# Altium schematic sheet MCU_ESP.SchDoc
size A; DocumentNumber: 5; SheetNumber: 5; SheetTotal: 14
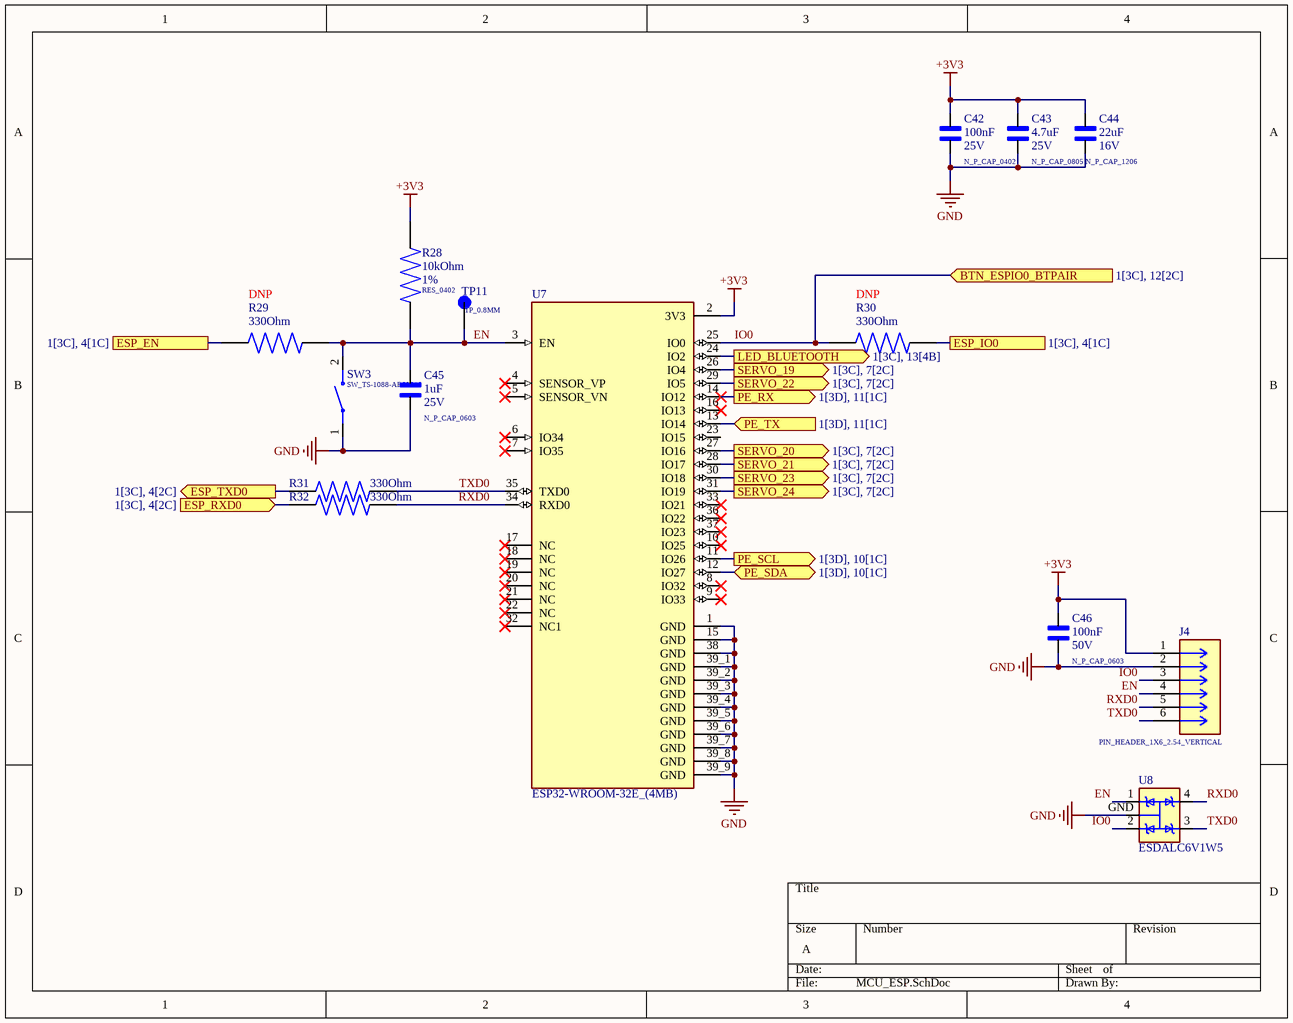
[diagram p0: MCU_ESP.SchDoc]

## Parts
C42  N_P_CAP_0402  value 100nF  Rated Voltage: 25V  [N_P_CAP_0402]
C43  N_P_CAP_0805  value 4.7uF  Rated Voltage: 25V  [N_P_CAP_0805]
C44  N_P_CAP_1206  value 22uF  Rated Voltage: 16V  [N_P_CAP_1206]
C45  N_P_CAP_0603  value 1uF  Rated Voltage: 25V  [N_P_CAP_0603]
C46  N_P_CAP_0603  value 100nF  Rated Voltage: 50V  [N_P_CAP_0603]
J4  PIN_HEADER_1X6_2.54_VERTICAL  [PIN_HEADER_1X6_2.54_VERTICAL]
R28  RES_0402  value 10kOhm  Tolerance: 1%  [RES_0402]
R29  value 330Ohm  [RES_0402]  (hidden comment: RES_0402)
R30  value 330Ohm  [RES_0402]  (hidden comment: RES_0402)
R31  value 330Ohm  [RES_0402]  (hidden comment: RES_0402)
R32  value 330Ohm  [RES_0402]  (hidden comment: RES_0402)
SW3  SW_TS-1088-AR02016  [SW_TS-1088-AR02016]
TP11  TP_0.8MM  [TP_0.8MM]
U7  ESP32-WROOM-32E_(4MB)  [XCVR_ESP32-WROOM-32E_(4MB)]
U8  ESDALC6V1W5  [SOT323-5L]

## Ports
BTN_ESPIO0_BTPAIR (in, see 1[3C], 12[2C]), ESP_EN (see 1[3C], 4[1C]), ESP_IO0 (see 1[3C], 4[1C]), ESP_RXD0 (in, see 1[3C], 4[2C]), ESP_TXD0 (out, see 1[3C], 4[2C]), LED_BLUETOOTH (out, see 1[3C], 13[4B]), PE_RX (out, see 1[3D], 11[1C]), PE_SCL (out, see 1[3D], 10[1C]), PE_SDA (bidir, see 1[3D], 10[1C]), PE_TX (in, see 1[3D], 11[1C]), SERVO_19 (out, see 1[3C], 7[2C]), SERVO_20 (out, see 1[3C], 7[2C]), SERVO_21 (out, see 1[3C], 7[2C]), SERVO_22 (out, see 1[3C], 7[2C]), SERVO_23 (out, see 1[3C], 7[2C]), SERVO_24 (out, see 1[3C], 7[2C])

## Nets
+3V3: C42.2 C43.2 C44.2 C46.2 J4.1 R28.1 U7.2(3V3)
GND: C42.1 C43.1 C44.1 C45.1 C46.1 J4.2 SW3.1 U7.1(GND) U7.15(GND) U7.38(GND) U7.39_1(GND) U7.39_2(GND) U7.39_3(GND) U7.39_4(GND) U7.39_5(GND) U7.39_6(GND) U7.39_7(GND) U7.39_8(GND) U7.39_9(GND) U8.GND
EN: C45.2 J4.4 R28.2 R29.1 SW3.2 TP11.TP U7.3(EN) U8.1(I/01)
ESP_EN: R29.2 ; port ESP_EN
ESP_IO0: R30.1 ; port ESP_IO0
ESP_RXD0: R32.2 ; port ESP_RXD0
ESP_TXD0: R31.2 ; port ESP_TXD0
IO0: J4.3 R30.2 U7.25(IO0) U8.2(I/02) ; port BTN_ESPIO0_BTPAIR
LED_BLUETOOTH: U7.24(IO2) ; port LED_BLUETOOTH
PE_RX: U7.14(IO12) ; port PE_RX
PE_SCL: U7.11(IO26) ; port PE_SCL
PE_SDA: U7.12(IO27) ; port PE_SDA
PE_TX: U7.13(IO14) ; port PE_TX
RXD0: J4.5 R32.1 U7.34(RXD0) U8.4(I/04)
SERVO_19: U7.26(IO4) ; port SERVO_19
SERVO_20: U7.27(IO16) ; port SERVO_20
SERVO_21: U7.28(IO17) ; port SERVO_21
SERVO_22: U7.29(IO5) ; port SERVO_22
SERVO_23: U7.30(IO18) ; port SERVO_23
SERVO_24: U7.31(IO19) ; port SERVO_24
TXD0: J4.6 R31.1 U7.35(TXD0) U8.3(I/03)

Not connected (* = marked no-connect by the designer): U7 4(SENSOR_VP)* 5(SENSOR_VN)* 6(IO34)* 7(IO35)* 8(IO32)* 9(IO33)* 10(IO25)* 16(IO13)* 17(NC)* 18(NC)* 19(NC)* 20(NC)* 21(NC)* 22(NC)* 23(IO15) 32(NC1)* 33(IO21)* 36(IO22)* 37(IO23)*

## Notes on the sheet
- (near R29) DNP
- (near R30) DNP

## Library data of the parts
C42 = N_P_CAP: GENERIC NON-POLARIZED CAP; Temperature Coefficient: X7R; LCSC Part Number: C105883; Tolerance: *; MF: *; ESR: *; MPN: *
C43 C45 C46 = N_P_CAP: GENERIC NON-POLARIZED CAP; Tolerance: *; MF: *; ESR: *; MPN: *; Temperature Coefficient: *
  C43: LCSC Part Number: C354262
  C45: LCSC Part Number: C106858
  C46: LCSC Part Number: C106221
C44 = N_P_CAP: GENERIC NON-POLARIZED CAP; MPN: CL31A226KOHNNNE; Tolerance: 10%; LCSC Part Number: C90146; MF: *; ESR: *; Temperature Coefficient: *
J4 = PIN_HEADER_6P: GENERIC PIN HEADER 6P; MF: *; MPN: *; LCSC Part Number: *
R28 = RES: GENERIC RES; Power Rating: *; MPN: *; Rated Voltage: *; Temperature Coefficient: *; LCSC Part Number: C60490
R29-R32 = RES: GENERIC RES; MPN: RC0402FR-07330RL; Tolerance: 1%; Power Rating: *; Rated Voltage: *; Temperature Coefficient: *; LCSC Part Number: C105875
SW3 = TACTILE_SWITCH_NO_SPST_2P: GENERIC TACTILE SWITCH NO SPST 2P; MF: *; MPN: *; LCSC Part Number: *
TP11 = TEST_POINT: GENERIC TEST POINT; MF: *; MPN: *
U7 = ESP32-WROOM-32E_(4MB): Bluetooth, WiFi 802.11b/g/n, Bluetooth v4.2 +EDR, Class 1, 2 and 3 Transceiver Module 2.4GHz ~ 2.5GHz Integrated, Trace Surface Mount; MPN: ESP32-WROOM-32E (4MB); MF: Espressif Systems; Package: SMD-44 Espressif Systems
U8 = ESDALC6V1W5: Clamp Ipp Tvs Diode Surface Mount SOT-323-5; MF: STMicroelectronics; Package: SOT-323 STMicroelectronics; MPN: ESDALC6V1W5; LCSC Part Number: C703691